# Altium schematic sheet Controller_Sheet.SchDoc
size A4; DocumentNumber: 4; SheetNumber: 4; SheetTotal: 4
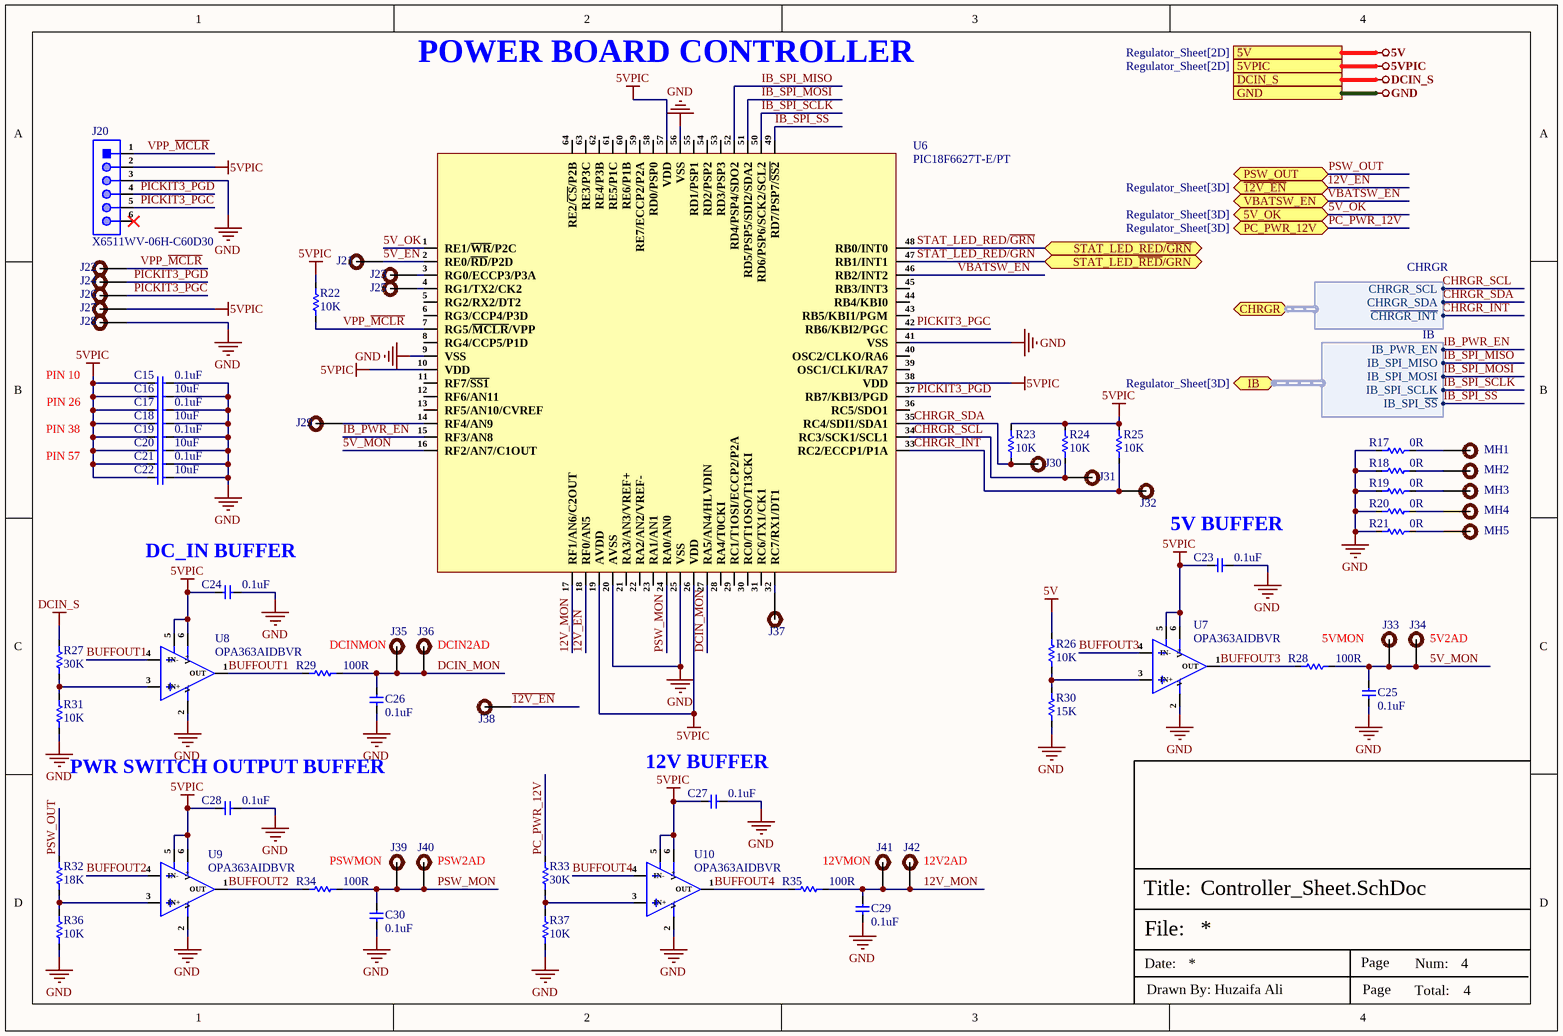
[diagram p0: Controller_Sheet.SchDoc]

## Parts
C15  0.1uF  [Cap-0402]
C16  10uF  [Cap-0603]
C17  0.1uF  [Cap-0402]
C18  10uF  [Cap-0603]
C19  0.1uF  [Cap-0402]
C20  10uF  [Cap-0603]
C21  0.1uF  [Cap-0402]
C22  10uF  [Cap-0603]
C23  0.1uF  [Cap-0402]
C24  0.1uF  [Cap-0402]
C25  0.1uF  [Cap-0603]
C26  0.1uF  [Cap-0603]
C27  0.1uF  [Cap-0402]
C28  0.1uF  [Cap-0402]
C29  0.1uF  [Cap-0603]
C30  0.1uF  [Cap-0603]
J20  X6511WV-06H-C60D30  [HDR1X6_]
J21  Test Point -TH 1.8mm Hole size 0.92mm  [Test Point -TH 1.8mm Hole size 0.92mm]  (value not drawn)  (no BOM)
J22  Test Point -TH 1.8mm Hole size 0.92mm  [Test Point -TH 1.8mm Hole size 0.92mm]  (value not drawn)  (no BOM)
J23  Test Point -TH 1.8mm Hole size 0.92mm  [Test Point -TH 1.8mm Hole size 0.92mm]  (value not drawn)  (no BOM)
J24  Test Point -TH 1.8mm Hole size 0.92mm  [Test Point -TH 1.8mm Hole size 0.92mm]  (value not drawn)  (no BOM)
J25  Test Point -TH 1.8mm Hole size 0.92mm  [Test Point -TH 1.8mm Hole size 0.92mm]  (value not drawn)  (no BOM)
J26  Test Point -TH 1.8mm Hole size 0.92mm  [Test Point -TH 1.8mm Hole size 0.92mm]  (value not drawn)  (no BOM)
J27  Test Point -TH 1.8mm Hole size 0.92mm  [Test Point -TH 1.8mm Hole size 0.92mm]  (value not drawn)  (no BOM)
J28  Test Point -TH 1.8mm Hole size 0.92mm  [Test Point -TH 1.8mm Hole size 0.92mm]  (value not drawn)  (no BOM)
J29  Test Point -TH 1.8mm Hole size 0.92mm  [Test Point -TH 1.8mm Hole size 0.92mm]  (value not drawn)  (no BOM)
J30  Test Point -TH 1.8mm Hole size 0.92mm  [Test Point -TH 1.8mm Hole size 0.92mm]  (value not drawn)  (no BOM)
J31  Test Point -TH 1.8mm Hole size 0.92mm  [Test Point -TH 1.8mm Hole size 0.92mm]  (value not drawn)  (no BOM)
J32  Test Point -TH 1.8mm Hole size 0.92mm  [Test Point -TH 1.8mm Hole size 0.92mm]  (value not drawn)  (no BOM)
J33  Test Point -TH 1.8mm Hole size 0.92mm  [Test Point -TH 1.8mm Hole size 0.92mm]  (value not drawn)  (no BOM)
J34  Test Point -TH 1.8mm Hole size 0.92mm  [Test Point -TH 1.8mm Hole size 0.92mm]  (value not drawn)  (no BOM)
J35  Test Point -TH 1.8mm Hole size 0.92mm  [Test Point -TH 1.8mm Hole size 0.92mm]  (value not drawn)  (no BOM)
J36  Test Point -TH 1.8mm Hole size 0.92mm  [Test Point -TH 1.8mm Hole size 0.92mm]  (value not drawn)  (no BOM)
J37  Test Point -TH 1.8mm Hole size 0.92mm  [Test Point -TH 1.8mm Hole size 0.92mm]  (value not drawn)  (no BOM)
J38  Test Point -TH 1.8mm Hole size 0.92mm  [Test Point -TH 1.8mm Hole size 0.92mm]  (value not drawn)  (no BOM)
J39  Test Point -TH 1.8mm Hole size 0.92mm  [Test Point -TH 1.8mm Hole size 0.92mm]  (value not drawn)  (no BOM)
J40  Test Point -TH 1.8mm Hole size 0.92mm  [Test Point -TH 1.8mm Hole size 0.92mm]  (value not drawn)  (no BOM)
J41  Test Point -TH 1.8mm Hole size 0.92mm  [Test Point -TH 1.8mm Hole size 0.92mm]  (value not drawn)  (no BOM)
J42  Test Point -TH 1.8mm Hole size 0.92mm  [Test Point -TH 1.8mm Hole size 0.92mm]  (value not drawn)  (no BOM)
MH1  4-40 Panhead Mounting Holes  [4-40 Panhead Mounting Holes]  (value not drawn)  (no BOM)
MH2  4-40 Panhead Mounting Holes  [4-40 Panhead Mounting Holes]  (value not drawn)  (no BOM)
MH3  4-40 Panhead Mounting Holes  [4-40 Panhead Mounting Holes]  (value not drawn)  (no BOM)
MH4  4-40 Panhead Mounting Holes  [4-40 Panhead Mounting Holes]  (value not drawn)  (no BOM)
MH5  4-40 Panhead Mounting Holes  [4-40 Panhead Mounting Holes]  (value not drawn)  (no BOM)
R17  0R  [Res-0805]
R18  0R  [Res-0805]
R19  0R  [Res-0805]
R20  0R  [Res-0805]
R21  0R  [Res-0805]
R22  10K  [Res-0402]
R23  10K  [Res-0402]
R24  10K  [Res-0402]
R25  10K  [Res-0402]
R26  10K  [Res-0603]
R27  30K  [Res-0603]
R28  100R  [Res-0603]
R29  100R  [Res-0603]
R30  15K  [Res-0603]
R31  10K  [Res-0603]
R32  18K  [Res-0603]
R33  30K  [Res-0603]
R34  100R  [Res-0603]
R35  100R  [Res-0603]
R36  10K  [Res-0603]
R37  10K  [Res-0603]
U6  PIC18F6627T-E/PT  [64-TQFP (10x10)]
U7  OPA363AIDBVR  [SOT-23-6]
U8  OPA363AIDBVR  [SOT-23-6]
U9  OPA363AIDBVR  [SOT-23-6]
U10  OPA363AIDBVR  [SOT-23-6]

## Ports
5V (see Regulator_Sheet[2D]), 5V_OK (bidir, see Regulator_Sheet[3D]), 5VPIC (see Regulator_Sheet[2D]), CHRGR (bidir, harness CHRGR, see Power_Sheet[2D]), DCIN_S (see Power_Sheet[3D], Regulator_Sheet[2D]), GND (see Power_Sheet[3D], Regulator_Sheet[2D]), IB (bidir, harness IB, see Regulator_Sheet[3D]), PC_PWR_12V (bidir, see Regulator_Sheet[3D]), PSW_OUT (bidir, see Power_Sheet[2D], Regulator_Sheet[3D]), STAT_LED_RED/~{GRN} (bidir, see Power_Sheet[3B]), STAT_LED_~{RED}/GRN (bidir, see Power_Sheet[3B]), VBATSW_EN (bidir, see Power_Sheet[2D]), ~{12V_EN} (bidir, see Regulator_Sheet[3D])

## Harnesses
IB: IB_PWR_EN, IB_SPI_MISO, IB_SPI_MOSI, IB_SPI_SCLK, IB_SPI_~{SS}
CHRGR: CHRGR_SCL, CHRGR_SDA, ~{CHRGR_INT}

## Nets
5V: R26.2 ; port 5V
5VPIC: C15.1 C16.1 C17.1 C18.1 C19.1 C20.1 C21.1 C22.1 C23.1 C24.1 C27.1 C28.1 J20.2 J27.1 R22.2 R23.2 R24.2 R25.2 U6.10(VDD) U6.19(AVDD) U6.26(VDD) U6.38(VDD) U6.57(VDD) U7.5(EN) U7.6(V+) U8.5(EN) U8.6(V+) U9.5(EN) U9.6(V+) U10.5(EN) U10.6(V+) ; port 5VPIC
DCIN_S: R27.2 ; port DCIN_S
GND: C15.2 C16.2 C17.2 C18.2 C19.2 C20.2 C21.2 C22.2 C23.2 C24.2 C25.2 C26.2 C27.2 C28.2 C29.2 C30.2 J20.3 J28.1 R17.1 R18.1 R19.1 R20.1 R21.1 R30.1 R31.1 R36.1 R37.1 U6.9(VSS) U6.20(AVSS) U6.25(VSS) U6.41(VSS) U6.56(VSS) U7.2(V-) U8.2(V-) U9.2(V-) U10.2(V-) ; port GND
~{12V_EN}: J38.1 U6.18(RF0/AN5)
~{5V_EN}: J21.1 U6.2(RE0/~{RD}/P2D)
5V_MON: C25.1 J33.1 J34.1 R28.2 U6.16(RF2/AN7/C1OUT)
5V_OK: U6.1(RE1/~{WR}/P2C) ; port 5V_OK
12V_MON: C29.1 J41.1 J42.1 R35.2 U6.17(RF1/AN6/C2OUT)
BUFFOUT1: R29.1 U8.1(OUT) U8.4(IN-)
BUFFOUT2: R34.1 U9.1(OUT) U9.4(IN-)
BUFFOUT3: R28.1 U7.1(OUT) U7.4(IN-)
BUFFOUT4: R35.1 U10.1(OUT) U10.4(IN-)
~{CHRGR_INT}: J32.1 R25.1 U6.33(RC2/ECCP1/P1A) ; port CHRGR.~{CHRGR_INT}
CHRGR_SCL: J31.1 R24.1 U6.34(RC3/SCK1/SCL1) ; port CHRGR.CHRGR_SCL
CHRGR_SDA: J30.1 R23.1 U6.35(RC4/SDI1/SDA1) ; port CHRGR.CHRGR_SDA
DCIN_MON: C26.1 J35.1 J36.1 R29.2 U6.27(RA5/AN4/HLVDIN)
IB_PWR_EN: U6.15(RF3/AN8) ; port IB.IB_PWR_EN
IB_SPI_MISO: U6.52(RD4/PSP4/SDO2) ; port IB.IB_SPI_MISO
IB_SPI_MOSI: U6.51(RD5/PSP5/SDI2/SDA2) ; port IB.IB_SPI_MOSI
IB_SPI_~{SS}: U6.49(RD7/PSP7/~{SS2}) ; port IB.IB_SPI_~{SS}
IB_SPI_SCLK: U6.50(RD6/PSP6/SCK2/SCL2) ; port IB.IB_SPI_SCLK
PC_PWR_12V: R33.2 ; port PC_PWR_12V
PICKIT3_PGC: J20.5 J26.1 U6.42(RB6/KBI2/PGC)
PICKIT3_PGD: J20.4 J24.1 U6.37(RB7/KBI3/PGD)
PSW_MON: C30.1 J39.1 J40.1 R34.2 U6.24(RA0/AN0)
PSW_OUT: R32.2 ; port PSW_OUT
STAT_LED_~{RED}/GRN: U6.47(RB1/INT1) ; port STAT_LED_~{RED}/GRN
STAT_LED_RED/~{GRN}: U6.48(RB0/INT0) ; port STAT_LED_RED/~{GRN}
VBATSW_EN: U6.46(RB2/INT2)
VPP_~{MCLR}: J20.1 J22.1 R22.1 U6.7(RG5/~{MCLR}/VPP)
NetJ23_1: J23.1 U6.3(RG0/ECCP3/P3A)
NetJ25_1: J25.1 U6.4(RG1/TX2/CK2)
NetJ29_1: J29.1 U6.14(RF4/AN9)
NetJ37_1: J37.1 U6.32(RC7/RX1/DT1)
NetMH1_MH: MH1.MH R17.2
NetMH2_MH: MH2.MH R18.2
NetMH3_MH: MH3.MH R19.2
NetMH4_MH: MH4.MH R20.2
NetMH5_MH: MH5.MH R21.2
NetR26_1: R26.1 R30.2 U7.3(IN+)
NetR27_1: R27.1 R31.2 U8.3(IN+)
NetR32_1: R32.1 R36.2 U9.3(IN+)
NetR33_1: R33.1 R37.2 U10.3(IN+)

Not connected (* = marked no-connect by the designer): J20 6*; U6 5(RG2/RX2/DT2) 6(RG3/CCP4/P3D) 8(RG4/CCP5/P1D) 11(RF7/~{SS1}) 12(RF6/AN11) 13(RF5/AN10/CVREF) 21(RA3/AN3/VREF+) 22(RA2/AN2/VREF-) 23(RA1/AN1) 28(RA4/T0CKI) 29(RC1/T1OSI/ECCP2/P2A) 30(RC0/T1OSO/T13CKI) 31(RC6/TX1/CK1) 36(RC5/SDO1) 39(OSC1/CLKI/RA7) 40(OSC2/CLKO/RA6) 43(RB5/KBI1/PGM) 44(RB4/KBI0) 45(RB3/INT3) 53(RD3/PSP3) 54(RD2/PSP2) 55(RD1/PSP1) 58(RD0/PSP0) 59(RE7/ECCP2/P2A) 60(RE6/P1B) 61(RE5/P1C) 62(RE4/P3B) 63(RE3/P3C) 64(RE2/~{CS}/P2B)

## Notes on the sheet
- POWER BOARD CONTROLLER
- PIN 10
- PIN 38
- PIN 26
- PIN 57
- (near C24) DC_IN BUFFER
- 5V BUFFER
- DCINMON
- (near J36) DCIN2AD
- (near R28) 5VMON
- (near J34) 5V2AD
- (near C28) PWR SWITCH OUTPUT BUFFER
- (near C27) 12V BUFFER
- PSWMON
- (near J40) PSW2AD
- 12VMON
- (near J42) 12V2AD
- Labels drawn without touching a wire or pin: VBATSW_EN, ~{12V_EN}
- File:
- Title:
- Date:
- Page
- Num:
- Total:
- Drawn By: Huzaifa Ali

## Library data of the parts
C15 C17 C19 C21 C23 C24 C27 C28 = GRM155R71C104KA88D: CAP CER 0.1UF 16V X7R 0402; Manufacturer: Murata; Material: Ceramic; Value: 100nF; Tolerance: 10%; Insulation Resistance: 10GR; Item Type: Capacitor; Supplier 1: Arrow Electronics; Manufacturer Part Number: GRM155R71C104KA88D; RoHS: Yes; Category: Ceramic Capacitors; Stock 1: 1690322; Pricing 1: 10000=0.00480, 30000=0.00470, 100000=0.00350, 250000=0.00330 (USD); Mounting Technology: Surface Mount; Case/Package: 0402; Pins: 2; Case Code (Metric): 1005; Case Code (Imperial): 0402; Dielectric Material: Ceramic; Min Operating Temperature: -55°C; Max Operating Temperature: 125°C; Voltage Rating: 16V; Packaging: Tape and Reel; Voltage Rating (DC): 16V; Package Quantity: 1; Dielectric: X7R; Termination: SMD/SMT; Voltage: 16V; Series: GRM; Length: 1mm; Width: 0.02inch; Height: 0.5mm; Thickness: 0.022inch; Depth: 0.5mm; Radiation Hardening: No; Lead Free: Lead Free; RoHS Compliant: Yes; ComponentLink1URL: https://datasheet.ciiva.com/129/grm155r71c104ka88-01-129739.pdf?src-supplier=Digi-Key; ComponentLink1Description: https://datasheet.ciiva.com/129/grm155r71c104ka88-01-129739.pdf?src-supplier=Digi-Key; ComponentLink2URL: https://datasheet.ciiva.com/129/grm155r71c104ka88-01-129740.pdf?src-supplier=Digi-Key; ComponentLink2Description: https://datasheet.ciiva.com/129/grm155r71c104ka88-01-129740.pdf?src-supplier=Digi-Key; ComponentLink3URL: https://datasheet.ciiva.com/18102/getdatasheetpartid-85307-18102905.pdf?src-supplier=Verical; ComponentLink3Description: https://datasheet.ciiva.com/18102/getdatasheetpartid-85307-18102905.pdf?src-supplier=Verical; ComponentLink4URL: https://datasheet.ciiva.com/29199/454098-da-01-en-vs-kondensator-0402-29199799.pdf?src-supplier=Conrad; ComponentLink4Description: https://datasheet.ciiva.com/29199/454098-da-01-en-vs-kondensator-0402-29199799.pdf?src-supplier=Conrad; ComponentLink5URL: https://datasheet.ciiva.com/7937/4360-7937615.pdf?src-supplier=Element14; ComponentLink5Description: https://datasheet.ciiva.com/7937/4360-7937615.pdf?src-supplier=Element14; ComponentLink6URL: https://datasheet.ciiva.com/14116/grmseries-highdielectrictype-eng-14116878.pdf?src-supplier=Distrelec; ComponentLink6Description: https://datasheet.ciiva.com/14116/grmseries-highdielectrictype-eng-14116878.pdf?src-supplier=Distrelec; ComponentLink7URL: https://datasheet.ciiva.com/14103/grmseries-highdielectrictype-eng-14103750.pdf?src-supplier=Distrelec; ComponentLink7Description: https://datasheet.ciiva.com/14103/grmseries-highdielectrictype-eng-14103750.pdf?src-supplier=Distrelec; ComponentLink8URL: https://datasheet.ciiva.com/28534/4360-28534127.pdf?src-supplier=Element14; ComponentLink8Description: https://datasheet.ciiva.com/28534/4360-28534127.pdf?src-supplier=Element14; ComponentLink9URL: https://datasheet.ciiva.com/28534/4360-28534133.pdf?src-supplier=Element14; ComponentLink9Description: https://datasheet.ciiva.com/28534/4360-28534133.pdf?src-supplier=Element14; ComponentLink10URL: https://datasheet.ciiva.com/16199/product-16199000.pdf?src-supplier=Future+Electronics; ComponentLink10Description: https://datasheet.ciiva.com/16199/product-16199000.pdf?src-supplier=Future+Electronics; Supplier Part Number 1: GRM155R71C104KA88D; LCSC Part Number: C71629
C16 C18 C20 C22 = CGA0603X5R106K100JT: 10V 10uF X5R ±10% 0603 Multilayer Ceramic Capacitors MLCC - SMD/SMT ROHS; Manufacturer: HRE; ComponentLink1Description: LCSC; ComponentLink1URL: https://www.lcsc.com/product-detail/Multilayer-Ceramic-Capacitors-MLCC-SMD-SMT_HRE-CGA0603X5R106K100JT_C6119842.html; Manufacturer Part Number: CGA0603X5R106K100JT; Package: 0603; LCSC Part Number: C6119842; Item Type: Capacitor
C25 C26 C29 C30 = CL10B104KB8NNNC: CAP CER 0.1UF 50V X7R 0603; Manufacturer: Samsung; Material: Ceramic; Capacitance: 100nF; Tolerance: 10%; Supplier 1: Digi-Key; Manufacturer Part Number: CL10B104KB8NNNC; RoHS: Yes; Category: Ceramic Capacitors; Stock 1: 3998791; Pricing 1: 1=0.10000, 10=0.03000, 50=0.01640, 100=0.01340, 500=0.00954, 1000=0.00750 (USD); Mount: Surface Mount; Case/Package: 0603; Case Code (Metric): 1608; Case Code (Imperial): 0603; Contact Plating: Tin; Min Operating Temperature: -55°C; Max Operating Temperature: 125°C; Dielectric: X7R; Voltage Rating: 50V; Package Quantity: 1; Packaging: Tape and Reel; Voltage: 50V; Voltage Rating (DC): 50V; Series: CL; Construction: Flat; Length: 1.6mm; Width: 0.031inch; Height: 0.8mm; Depth: 0.8mm; Thickness: 0.035inch; Radiation Hardening: No; Lead Free: Lead Free; RoHS Compliant: Yes; ComponentLink1URL: https://datasheet.ciiva.com/25803/cl10b104kb8nnnc-25803393.pdf?src-supplier=Digi-Key; ComponentLink1Description: https://datasheet.ciiva.com/25803/cl10b104kb8nnnc-25803393.pdf?src-supplier=Digi-Key; ComponentLink2URL: https://datasheet.ciiva.com/26838/getdatasheetpartid-89097-26838411.pdf?src-supplier=Verical; ComponentLink2Description: https://datasheet.ciiva.com/26838/getdatasheetpartid-89097-26838411.pdf?src-supplier=Verical; ComponentLink3URL: https://datasheet.ciiva.com/29198/456651-da-01-en-vs-kondensator-0605-29198839.pdf?src-supplier=Conrad; ComponentLink3Description: https://datasheet.ciiva.com/29198/456651-da-01-en-vs-kondensator-0605-29198839.pdf?src-supplier=Conrad; Supplier Part Number 1: 1276-1000-1-ND; LCSC Part Number: C1591
J20 = X6511WV-06H-C60D30: Gold 250V 3A Straight Square Pins 2.5mm 6P 260℃ 6mm -40℃~+105℃ 3mm 2.54mm Plugin Black Brass 1x6P Plugin,P=2.54mm Pin Headers ROHS; Manufacturer: XKB; Item Type: Male Header; Manufacturer Part Number: X6511WV-06H-C60D30; Package: Plugin,P=2.54mm; LCSC Part Number: C706878; ComponentLink1Description: LCSC; ComponentLink1URL: https://www.lcsc.com/product-detail/Pin-Headers_XKB-Connectivity-X6511WV-06H-C60D30_C706878.html
MH1-MH5 = 4-40 Panhead Mounting Holes: -; Manufacturer Part Number: M4 Mounting Hole; Item Type: Mounting Hole
R17-R21 = RC0805FR-070RL: RES 0 OHM JUMPER 1/8W 0805; Manufacturer: Yageo; Resistance: 0mR; Tolerance: 1%; Power Rating: 125mW; Item Type: Resistor; Supplier 1: Avnet; Manufacturer Part Number: RC0805FR-070RL; RoHS: Yes; Category: Chip SMD Resistors; Stock 1: 85000; Pricing 1: 5000=0.00281, 10000=0.00277, 20000=0.00269 (USD); Case/Package: 0805; Contact Plating: Tin,Matte; Case Code (Imperial): 0805; Case Code (Metric): 2012; Size Code: 0805; Min Operating Temperature: -55°C; Max Operating Temperature: 155°C; Resistor Type: Thick Film; Packaging: Tape and Reel; Features: Moisture Resistant; Series: RC; Max Power Dissipation: 125mW; Number of Terminations: 2; Construction: Rectangular; Length: 2mm; Depth: 1.25mm; Radiation Hardening: No; Military Standard: Not; Lead Free: Lead Free; RoHS Compliant: Yes; ComponentLink1URL: https://datasheet.ciiva.com/15189/getdatasheetpartid-348154-15189885.pdf?src-supplier=Verical; ComponentLink1Description: https://datasheet.ciiva.com/15189/getdatasheetpartid-348154-15189885.pdf?src-supplier=Verical; ComponentLink2URL: https://datasheet.ciiva.com/17042/rc0805-17042698.pdf?src-supplier=Future+Electronics; ComponentLink2Description: https://datasheet.ciiva.com/17042/rc0805-17042698.pdf?src-supplier=Future+Electronics; Supplier Part Number 1: RC0805FR-070RL; LCSC Part Number: C100045
R22-R25 = RC0402FR-0710KL: RES 10K OHM 1% 1/16W 0402; Manufacturer: Yageo; Resistance: 10kR; Voltage Rating (DC): 50V; Temperature Coefficient: 100ppm/°C; Power Rating: 62.5mW; Max Power Dissipation: 63mW; Item Type: Resistor; Supplier 1: Mouser; Manufacturer Part Number: RC0402FR-0710KL; RoHS: Yes; Category: Chip SMD Resistors; Stock 1: 18648329; Pricing 1: 1=0.10000, 10=0.01400, 50=0.01400, 100=0.00500, 1000=0.00300, 10000=0.00200 (USD); Case/Package: 0402; Number of Pins: 2; Case Code (Imperial): 0402; Case Code (Metric): 1005; Min Operating Temperature: -55°C; Max Operating Temperature: 155°C; Resistor Type: Thick Film; Tolerance: 1%; Packaging: Tape and Reel; Voltage Rating: 50V; Termination: SMD/SMT; Working Voltage: 50V; Number of Terminations: 2; Features: Moisture Resistant; Series: RC; Resistance Tolerance: 1%; Construction: Rectangular; Length: 1mm; Width: 0.5mm; Height: 0.32mm; Depth: 0.5mm; Lead Pitch: 0.2mm; REACH SVHC: No SVHC; Lead Free: Lead Free; RoHS Compliant: Yes; Military Standard: Not; ComponentLink1URL: https://datasheet.ciiva.com/7660/38568-7660787.pdf?src-supplier=Element14; ComponentLink1Description: https://datasheet.ciiva.com/7660/38568-7660787.pdf?src-supplier=Element14; ComponentLink2URL: https://datasheet.ciiva.com/7849/1686128-7849814.pdf?src-supplier=Element14; ComponentLink2Description: https://datasheet.ciiva.com/7849/1686128-7849814.pdf?src-supplier=Element14; ComponentLink3URL: https://datasheet.ciiva.com/7983/1018594-7983486.pdf?src-supplier=Element14; ComponentLink3Description: https://datasheet.ciiva.com/7983/1018594-7983486.pdf?src-supplier=Element14; ComponentLink4URL: https://datasheet.ciiva.com/22747/1018594-22747512.pdf?src-supplier=Element14; ComponentLink4Description: https://datasheet.ciiva.com/22747/1018594-22747512.pdf?src-supplier=Element14; ComponentLink5URL: https://datasheet.ciiva.com/12667/pyu-rc0402-51-rohs-l-6-r-12667067.pdf?src-supplier=Mouser; ComponentLink5Description: https://datasheet.ciiva.com/12667/pyu-rc0402-51-rohs-l-6-r-12667067.pdf?src-supplier=Mouser; ComponentLink6URL: https://datasheet.ciiva.com/7849/1784430-7849813.pdf?src-supplier=Element14; ComponentLink6Description: https://datasheet.ciiva.com/7849/1784430-7849813.pdf?src-supplier=Element14; ComponentLink7URL: https://datasheet.ciiva.com/7849/1784430-7849815.pdf?src-supplier=Element14; ComponentLink7Description: https://datasheet.ciiva.com/7849/1784430-7849815.pdf?src-supplier=Element14; Supplier Part Number 1: 603-RC0402FR-0710KL; LCSC Part Number: C60490
R26 R31 R36 R37 = RNCS0603BKE10K0: Res Thin Film 0603 10K Ohm 0.1% 0.063W(1/16W) ±25ppm/C Pad SMD Automotive T/R; Manufacturer: Stackpole Electronics; Value: 10kR; Temperature Coefficient: 25ppm/°C; Max Power Dissipation: 63mW; Supplier: Digikey; Supplier Part Number: RNCS0603BKE10K0CT-ND; Manufacturer Part Number: RNCS0603BKE10K0; RoHS: Yes; Category: Chip SMD Resistors; Stock: 21197; Pricing: 1=0.26, 10=0.191, 50=0.149, 100=0.133, 500=0.10048 (USD); Mounting Technology: Surface Mount; Case/Package: 0603; Contact Plating: Tin,Matte; Case Code (Metric): 1608; Case Code (Imperial): 0603; Min Operating Temperature: -55°C; Max Operating Temperature: 155°C; Tolerance: 0.1%; Packaging: Tape and Reel; Number of Terminations: 2; Features: Moisture Resistant,Automotive AEC-Q200; Series: RNCS; Length: 0.061inch; Width: 0.031inch; Height: 0.022inch; Radiation Hardening: No; Lead Free: Lead Free; RoHS Compliant: Yes; ComponentLink1URL: https://datasheet.ciiva.com/2479/sei-rncs-rnch-2479443.pdf?src-supplier=Digikey; ComponentLink1Description: https://datasheet.ciiva.com/2479/sei-rncs-rnch-2479443.pdf?src-supplier=Digikey; ComponentLink2URL: https://datasheet.ciiva.com/2479/sei-rncs-rnch-2479444.pdf?src-supplier=Digikey; ComponentLink2Description: https://datasheet.ciiva.com/2479/sei-rncs-rnch-2479444.pdf?src-supplier=Digikey
R27 R33 = CPF0603B30KE1: Res Thin Film 0603 30K Ohm 0.1% 0.063W(1/16W) ±25ppm/C Epoxy Pad SMD Medical T/R; Manufacturer: TE Connectivity; Operating Supply Voltage: 50V; Supplier: Digikey; Supplier Part Number: A103082CT-ND; Manufacturer Part Number: CPF0603B30KE1; RoHS: Yes; Category: Chip SMD Resistors; Stock: 3038; Pricing: 1=0.42, 10=0.299, 50=0.2326, 100=0.2077, 500=0.15724 (USD); Voltage Rating (DC): 50V; ELV: 5681ELVCompliant; ComponentLink1URL: https://datasheet.ciiva.com/22670/1723857-22670797.pdf?src-supplier=Element14; ComponentLink1Description: https://datasheet.ciiva.com/22670/1723857-22670797.pdf?src-supplier=Element14; ComponentLink2URL: https://datasheet.ciiva.com/28584/1723857-28584543.pdf?src-supplier=Element14; ComponentLink2Description: https://datasheet.ciiva.com/28584/1723857-28584543.pdf?src-supplier=Element14
R28 R29 R34 R35 = RC0603FR-07100RL: RES SMD 100 OHM 1% 1/10W 0603; Manufacturer: Yageo; Temperature Coefficient: 100ppm/°C; Voltage Rating (DC): 50V; Power Rating: 100mW; Item Type: Resistor; Supplier 1: Arrow Electronics; Manufacturer Part Number: RC0603FR-07100RL; RoHS: Yes; Category: Chip SMD Resistors; Stock 1: 3800000; Pricing 1: 5000=0.00300, 5000=0.00200, 5000=0.00450, 50000=0.00410, 500000=0.00230, 2500000=0.00140 (USD); Case/Package: 0603; Number of Pins: 2; Case Code (Imperial): 0603; Case Code (Metric): 1608; Size Code: 0603; Min Operating Temperature: -55°C; Max Operating Temperature: 155°C; Resistance: 100R; Tolerance: 1%; Resistor Type: Thick Film; Packaging: Tape and Reel; Voltage Rating: 50V; Termination: SMD/SMT; Features: Moisture Resistant; Series: RC; Max Power Dissipation: 100mW; Number of Terminations: 2; Construction: Rectangular; Resistance Tolerance: 1%; Technology: THICK FILM; Length: 1.6mm; Width: 0.8mm; Height: 0.45mm; Depth: 0.8mm; REACH SVHC: Unknown; Lead Free: Lead Free; RoHS Compliant: Yes; Military Standard: Not; Supplier Part Number 1: RC0603FR-07100RL; LCSC Part Number: C105588
R30 = CPF0603B15KE1: Res Thin Film 0603 15K Ohm 0.1% 0.063W(1/16W) ±25ppm/C Pad SMD T/R; Manufacturer: TE Connectivity Neohm; Voltage Rating: 50V; Number of Resistors: 1; Voltage Rating (DC): 120V; Value: 15kR; Power Rating: 63mW; Temperature Coefficient: 25ppm/°C; Supplier: Digikey; Supplier Part Number: A103258CT-ND; Manufacturer Part Number: CPF0603B15KE1; RoHS: Yes; Category: Chip SMD Resistors; Stock: 29093; Pricing: 1=0.39, 10=0.285, 50=0.2196, 100=0.1951, 500=0.14598 (USD); Mounting Technology: Surface Mount; Case/Package: 0603; Pins: 2; Weight: 7.1E-05oz; Case Code (Imperial): 0603; Case Code (Metric): 1608; Min Operating Temperature: -55°C; Max Operating Temperature: 155°C; Termination: Solder; Operating Supply Voltage: 50V; Tolerance: 0.1%; Resistor Type: Thin Film; Packaging: Tape and Reel; Package Quantity: 1000; Number of Terminations: 2; Series: CPF; Max Power Dissipation: 63mW; Resistance Tolerance: 0.1%; Length: 1.55mm; Width: 0.8mm; Height: 0.45mm; Depth: 800um; Radiation Hardening: 5898YesNo; ELV: 5681ELVCompliant; Reach SVHC Compliant: No; Lead Free: 5697LeadFree; RoHS Compliant: Yes; Military Standard: 4991MilitaryStandard; ComponentLink1URL: https://datasheet.ciiva.com/12795/eng-ds-1773200-i-12795533.pdf?src-supplier=Mouser; ComponentLink1Description: https://datasheet.ciiva.com/12795/eng-ds-1773200-i-12795533.pdf?src-supplier=Mouser
R32 = CPF0603B18KE1: Res Thin Film 0603 18K Ohm 0.1% 0.063W(1/16W) ±25ppm/C Pad SMD T/R; Manufacturer: TE Connectivity Neohm; Supplier: Digikey; Supplier Part Number: A103052DKR-ND; Manufacturer Part Number: CPF0603B18KE1; RoHS: Yes; Category: Chip SMD Resistors; Stock: 10956; Pricing: 1=0.4, 10=0.291, 50=0.2244, 100=0.1993, 500=0.14912 (USD); ComponentLink1URL: https://datasheet.ciiva.com/7789/eng-ds-1773200-j-7789479.pdf?src-supplier=Element14; ComponentLink1Description: https://datasheet.ciiva.com/7789/eng-ds-1773200-j-7789479.pdf?src-supplier=Element14; ComponentLink2URL: https://datasheet.ciiva.com/7789/eng-ds-1773200-j-7789480.pdf?src-supplier=Element14; ComponentLink2Description: https://datasheet.ciiva.com/7789/eng-ds-1773200-j-7789480.pdf?src-supplier=Element14
U6 = PIC18F6627T-E/PT: IC MCU 8BIT 96KB FLASH 64TQFP; Manufacturer: Microchip; Item Type: Microcontrollers; Interface: I2C,SPI,UART,USART; Number of Timers/Counters: 5; Max Supply Voltage: 5.5V; Min Supply Voltage: 4.2V; Frequency: 40MHz; RAM Size: 3936B; Operating Supply Voltage: 5V; Max Power Dissipation: 1W; Data Bus Width: 8b; Number of Programmable I/O: 54; Watchdog Timer: Yes; Access Time: 40us; Core Architecture: PIC; Peripherals: Brown-out Detect/Reset,POR,PWM,WDT,HLVD; Oscillator Type: Internal; Supplier: Digikey; Supplier Part Number: PIC18F6627T-E/PT-ND; Manufacturer Part Number: PIC18F6627T-E/PT; RoHS: Yes; Pricing: 1200=9.8625 (USD); Mounting Technology: Surface Mount; Case/Package: TQFP; Pins: 64; Min Operating Temperature: -40°C; Max Operating Temperature: 125°C; Package Quantity: 1200; Packaging: Tape and Reel; Clock Frequency: 40MHz; Memory Format: FLASH; Memory Size: 96KB; Series: PIC® 18F; Radiation Hardening: No; Lead Free: Lead Free; RoHS Compliant: Yes; ComponentLink1URL: https://datasheet.ciiva.com/1496/39646c-1496640.pdf?src-supplier=Avnet; ComponentLink1Description: https://datasheet.ciiva.com/1496/39646c-1496640.pdf?src-supplier=Avnet; ComponentLink2URL: https://datasheet.ciiva.com/6650/39646c-6650215.pdf?src-supplier=Digikey; ComponentLink2Description: https://datasheet.ciiva.com/6650/39646c-6650215.pdf?src-supplier=Digikey
U7-U10 = OPA363AIDBVR: IC OPAMP GP 1 CIRCUIT SOT23-6; Manufacturer: Texas Instruments; Supplier 1: Digikey; Manufacturer Part Number: OPA363AIDBVR; RoHS: Yes; Item Type: IC; Stock 1: 2246; Pricing 1: 1=1.86, 10=1.67, 25=1.5756, 100=1.3424, 250=1.26048, 500=1.10292, 1000=0.91385 (USD); ComponentLink1URL: https://datasheet.ciiva.com/1813/opa2364-1813015.pdf?src-supplier=Digikey; ComponentLink1Description: https://datasheet.ciiva.com/1813/opa2364-1813015.pdf?src-supplier=Digikey; Supplier Part Number 1: 296-48631-1-ND; LCSC Part Number: C2058417